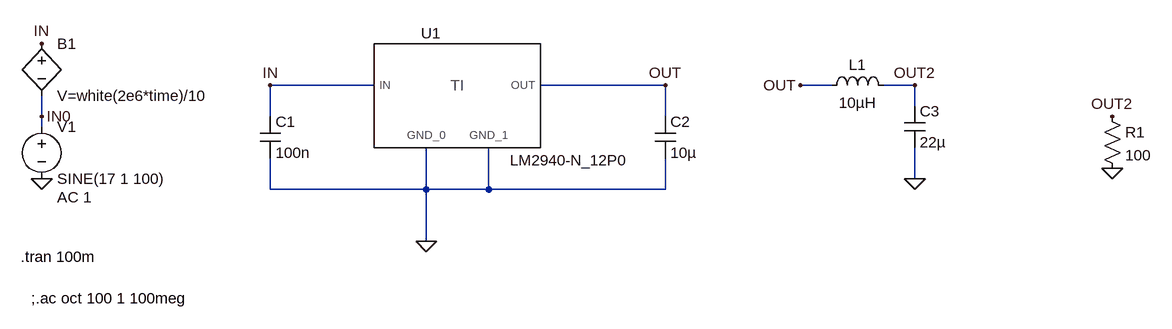
[diagram p0: schematic lm2940_12v0.asc]
lm2940_12v0.asc, the LTspice schematic file:
Version 4
SHEET 1 1248 680
WIRE 48 144 -112 144
WIRE 496 144 304 144
WIRE 752 144 704 144
WIRE 880 144 832 144
WIRE 880 176 880 144
WIRE -464 192 -464 160
WIRE -112 192 -112 144
WIRE 496 192 496 144
WIRE -464 208 -464 192
WIRE 880 288 880 240
WIRE -112 304 -112 256
WIRE 128 304 128 240
WIRE 128 304 -112 304
WIRE 224 304 224 240
WIRE 224 304 128 304
WIRE 496 304 496 256
WIRE 496 304 224 304
WIRE 128 384 128 304
FLAG 128 384 0
FLAG -464 288 0
FLAG -464 80 IN
FLAG -112 144 IN
FLAG 496 144 OUT
FLAG 1184 272 0
FLAG 704 144 OUT
FLAG 880 288 0
FLAG 880 144 OUT2
FLAG 1184 192 OUT2
FLAG -464 192 IN0
SYMBOL cap -128 192 R0
SYMATTR InstName C1
SYMATTR Value 100n
SYMATTR SpiceLine V=25 Irms=4.4 Rser=0.0272828 Lser=0
SYMBOL cap 480 192 R0
SYMATTR InstName C2
SYMATTR Value 10µ
SYMATTR SpiceLine V=10 Irms=15.2 Rser=0.00330355 Lser=0
SYMBOL voltage -464 192 R0
WINDOW 123 24 124 Left 2
WINDOW 39 0 0 Left 2
SYMATTR Value2 AC 1
SYMATTR InstName V1
SYMATTR Value SINE(17 1 100)
SYMBOL res 1168 176 R0
SYMATTR InstName R1
SYMATTR Value 100
SYMBOL ind 736 160 R270
WINDOW 0 32 56 VTop 2
WINDOW 3 5 56 VBottom 2
SYMATTR InstName L1
SYMATTR Value 10µH
SYMATTR SpiceLine Ipk=5 Rser=0.07
SYMBOL cap 864 176 R0
SYMATTR InstName C3
SYMATTR Value 22µ
SYMATTR SpiceLine V=16 Irms=11.2 Rser=0.00392876 Lser=0 mfg="KEMET" pn="C1210C226K4PAC" type="X5R"
SYMBOL bv -464 64 R0
SYMATTR InstName B1
SYMATTR Value V=white(2e6*time)/10
SYMBOL my\\LM2940-N_12P0 176 144 R0
WINDOW 3 81 115 Left 2
SYMATTR InstName U1
TEXT -496 408 Left 2 !.tran 100m
TEXT -480 472 Left 2 !;.ac oct 100 1 100meg

The netlist it stands for:
* lm2940_12v0.asc
C1 IN 0 100n V=25 Irms=4.4 Rser=0.0272828 Lser=0
C2 OUT 0 10µ V=10 Irms=15.2 Rser=0.00330355 Lser=0
V1 IN0 0 SINE(17 1 100) AC 1
R1 OUT2 0 100
L1 OUT OUT2 10µH Ipk=5 Rser=0.07
C3 OUT2 0 22µ V=16 Irms=11.2 Rser=0.00392876 Lser=0 mfg="KEMET" pn="C1210C226K4PAC" type="X5R"
B1 IN IN0 V=white(2e6*time)/10
XU1 IN OUT 0 0 LM2940-N_12P0_TRANS  ; pins IN OUT GND_0 GND_1
.tran 100m
;.ac oct 100 1 100meg
.lib LM2940-N_12P0_TRANS.lib
.backanno
.end